# Altium schematic sheet PMODs_MIO.SchDoc
size A4; SheetNumber: 1; SheetTotal: 13
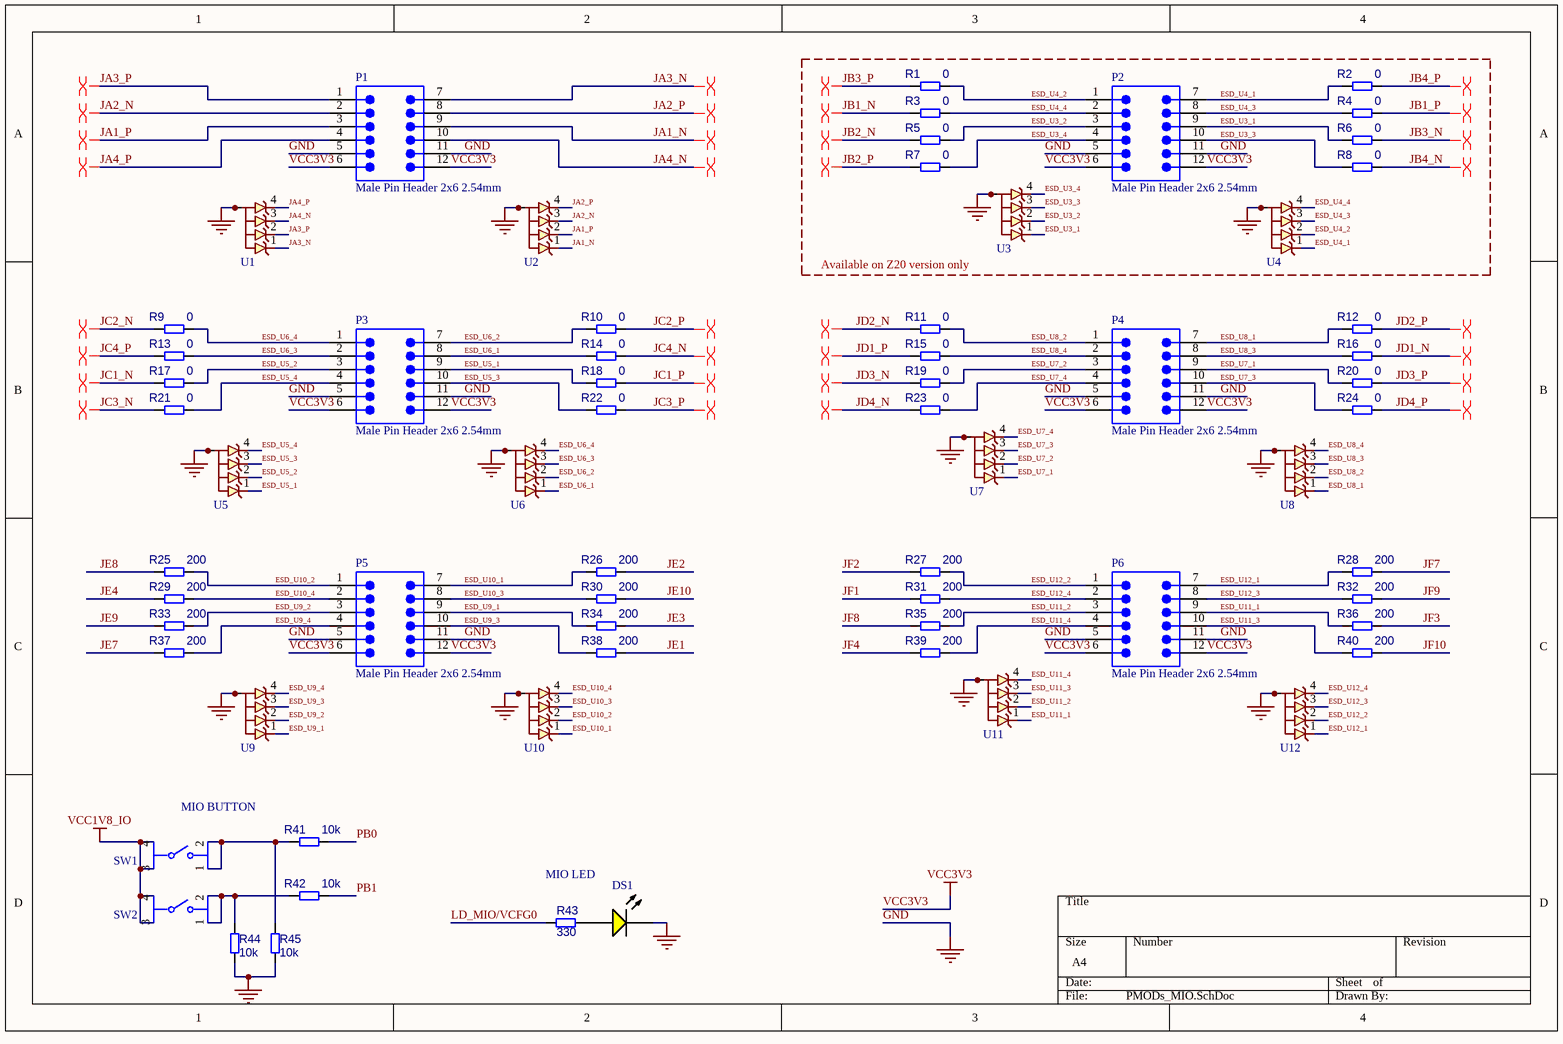
[diagram p0: PMODs_MIO.SchDoc]

## Parts
DS1  19-217/Y5C-AM1N1VY/3T  [EVRL-0603-2_V]  (value not drawn)
P1  Male Pin Header 2x6 2.54mm  [Copy of Copy of Copy of 3M-2340-6111TG_V]
P2  Male Pin Header 2x6 2.54mm  [Copy of Copy of Copy of 3M-2340-6111TG_V]
P3  Male Pin Header 2x6 2.54mm  [Copy of Copy of Copy of 3M-2340-6111TG_V]
P4  Male Pin Header 2x6 2.54mm  [Copy of Copy of Copy of 3M-2340-6111TG_V]
P5  Male Pin Header 2x6 2.54mm  [Copy of Copy of Copy of 3M-2340-6111TG_V]
P6  Male Pin Header 2x6 2.54mm  [Copy of Copy of Copy of 3M-2340-6111TG_V]
R1  0  [R_0402]
R2  0  [R_0402]
R3  0  [R_0402]
R4  0  [R_0402]
R5  0  [R_0402]
R6  0  [R_0402]
R7  0  [R_0402]
R8  0  [R_0402]
R9  0  [R_0402]
R10  0  [R_0402]
R11  0  [R_0402]
R12  0  [R_0402]
R13  0  [R_0402]
R14  0  [R_0402]
R15  0  [R_0402]
R16  0  [R_0402]
R17  0  [R_0402]
R18  0  [R_0402]
R19  0  [R_0402]
R20  0  [R_0402]
R21  0  [R_0402]
R22  0  [R_0402]
R23  0  [R_0402]
R24  0  [R_0402]
R25  200  [R_0402]
R26  200  [R_0402]
R27  200  [R_0402]
R28  200  [R_0402]
R29  200  [R_0402]
R30  200  [R_0402]
R31  200  [R_0402]
R32  200  [R_0402]
R33  200  [R_0402]
R34  200  [R_0402]
R35  200  [R_0402]
R36  200  [R_0402]
R37  200  [R_0402]
R38  200  [R_0402]
R39  200  [R_0402]
R40  200  [R_0402]
R41  10k  [R_0402]
R42  10k  [R_0402]
R43  330  [R_0402]
R44  10k  [R_0402]
R45  10k  [R_0402]
SW1  1301.9316.24  [FP-1301_9316_24-MFG]  (value not drawn)
SW2  1301.9316.24  [FP-1301_9316_24-MFG]  (value not drawn)
U1  TVS0701DRBR  [FP-DRB0008A-MFG]  (value not drawn)
U2  TVS0701DRBR  [FP-DRB0008A-MFG]  (value not drawn)
U3  TVS0701DRBR  [FP-DRB0008A-MFG]  (value not drawn)
U4  TVS0701DRBR  [FP-DRB0008A-MFG]  (value not drawn)
U5  TVS0701DRBR  [FP-DRB0008A-MFG]  (value not drawn)
U6  TVS0701DRBR  [FP-DRB0008A-MFG]  (value not drawn)
U7  TVS0701DRBR  [FP-DRB0008A-MFG]  (value not drawn)
U8  TVS0701DRBR  [FP-DRB0008A-MFG]  (value not drawn)
U9  TVS0701DRBR  [FP-DRB0008A-MFG]  (value not drawn)
U10  TVS0701DRBR  [FP-DRB0008A-MFG]  (value not drawn)
U11  TVS0701DRBR  [FP-DRB0008A-MFG]  (value not drawn)
U12  TVS0701DRBR  [FP-DRB0008A-MFG]  (value not drawn)

## Blocks framed on the sheet
Available on Z20 version only: P2 R1-R8 U3 U4

## Nets
GND: DS1.2(K) P1.5 P1.11 P2.5 P2.11 P3.5 P3.11 P4.5 P4.11 P5.5 P5.11 P6.5 P6.11 R44.1 R45.1 U1.5(GND) U1.6(GND) U1.7(GND) U1.8(GND) U1.9(Thermal_Pad) U2.5(GND) U2.6(GND) U2.7(GND) U2.8(GND) U2.9(Thermal_Pad) U3.5(GND) U3.6(GND) U3.7(GND) U3.8(GND) U3.9(Thermal_Pad) U4.5(GND) U4.6(GND) U4.7(GND) U4.8(GND) U4.9(Thermal_Pad) U5.5(GND) U5.6(GND) U5.7(GND) U5.8(GND) U5.9(Thermal_Pad) U6.5(GND) U6.6(GND) U6.7(GND) U6.8(GND) U6.9(Thermal_Pad) U7.5(GND) U7.6(GND) U7.7(GND) U7.8(GND) U7.9(Thermal_Pad) U8.5(GND) U8.6(GND) U8.7(GND) U8.8(GND) U8.9(Thermal_Pad) U9.5(GND) U9.6(GND) U9.7(GND) U9.8(GND) U9.9(Thermal_Pad) U10.5(GND) U10.6(GND) U10.7(GND) U10.8(GND) U10.9(Thermal_Pad) U11.5(GND) U11.6(GND) U11.7(GND) U11.8(GND) U11.9(Thermal_Pad) U12.5(GND) U12.6(GND) U12.7(GND) U12.8(GND) U12.9(Thermal_Pad)
VCC1V8_IO: SW1.3 SW1.4 SW2.3 SW2.4
VCC3V3: P1.6 P1.12 P2.6 P2.12 P3.6 P3.12 P4.6 P4.12 P5.6 P5.12 P6.6 P6.12
ESD_U3_1: P2.9 R6.1 U3.1(IN)
ESD_U3_2: P2.3 R5.2 U3.2(IN)
ESD_U3_3: P2.10 R8.1 U3.3(IN)
ESD_U3_4: P2.4 R7.2 U3.4(IN)
ESD_U4_1: P2.7 R2.1 U4.1(IN)
ESD_U4_2: P2.1 R1.2 U4.2(IN)
ESD_U4_3: P2.8 R4.1 U4.3(IN)
ESD_U4_4: P2.2 R3.2 U4.4(IN)
ESD_U5_1: P3.9 R18.1 U5.1(IN)
ESD_U5_2: P3.3 R17.2 U5.2(IN)
ESD_U5_3: P3.10 R22.1 U5.3(IN)
ESD_U5_4: P3.4 R21.2 U5.4(IN)
ESD_U6_1: P3.8 R14.1 U6.1(IN)
ESD_U6_2: P3.7 R10.1 U6.2(IN)
ESD_U6_3: P3.2 R13.2 U6.3(IN)
ESD_U6_4: P3.1 R9.2 U6.4(IN)
ESD_U7_1: P4.9 R20.1 U7.1(IN)
ESD_U7_2: P4.3 R19.2 U7.2(IN)
ESD_U7_3: P4.10 R24.1 U7.3(IN)
ESD_U7_4: P4.4 R23.2 U7.4(IN)
ESD_U8_1: P4.7 R12.1 U8.1(IN)
ESD_U8_2: P4.1 R11.2 U8.2(IN)
ESD_U8_3: P4.8 R16.1 U8.3(IN)
ESD_U8_4: P4.2 R15.2 U8.4(IN)
ESD_U9_1: P5.9 R34.1 U9.1(IN)
ESD_U9_2: P5.3 R33.2 U9.2(IN)
ESD_U9_3: P5.10 R38.1 U9.3(IN)
ESD_U9_4: P5.4 R37.2 U9.4(IN)
ESD_U10_1: P5.7 R26.1 U10.1(IN)
ESD_U10_2: P5.1 R25.2 U10.2(IN)
ESD_U10_3: P5.8 R30.1 U10.3(IN)
ESD_U10_4: P5.2 R29.2 U10.4(IN)
ESD_U11_1: P6.9 R36.1 U11.1(IN)
ESD_U11_2: P6.3 R35.2 U11.2(IN)
ESD_U11_3: P6.10 R40.1 U11.3(IN)
ESD_U11_4: P6.4 R39.2 U11.4(IN)
ESD_U12_1: P6.7 R28.1 U12.1(IN)
ESD_U12_2: P6.1 R27.2 U12.2(IN)
ESD_U12_3: P6.8 R32.1 U12.3(IN)
ESD_U12_4: P6.2 R31.2 U12.4(IN)
JA1_N: P1.9 U2.1(IN)
JA1_P: P1.3 U2.2(IN)
JA2_N: P1.2 U2.3(IN)
JA2_P: P1.8 U2.4(IN)
JA3_N: P1.7 U1.1(IN)
JA3_P: P1.1 U1.2(IN)
JA4_N: P1.10 U1.3(IN)
JA4_P: P1.4 U1.4(IN)
JB1_N: R3.1
JB1_P: R4.2
JB2_N: R5.1
JB2_P: R7.1
JB3_N: R6.2
JB3_P: R1.1
JB4_N: R8.2
JB4_P: R2.2
JC1_N: R17.1
JC1_P: R18.2
JC2_N: R9.1
JC2_P: R10.2
JC3_N: R21.1
JC3_P: R22.2
JC4_N: R14.2
JC4_P: R13.1
JD1_N: R16.2
JD1_P: R15.1
JD2_N: R11.1
JD2_P: R12.2
JD3_N: R19.1
JD3_P: R20.2
JD4_N: R23.1
JD4_P: R24.2
JE1: R38.2
JE2: R26.2
JE3: R34.2
JE4: R29.1
JE7: R37.1
JE8: R25.1
JE9: R33.1
JE10: R30.2
JF1: R31.1
JF2: R27.1
JF3: R36.2
JF4: R39.1
JF7: R28.2
JF8: R35.1
JF9: R32.2
JF10: R40.2
LD_MIO/VCFG0: R43.2
PB0: R41.2
PB1: R42.2
NetDS1_1: DS1.1(A) R43.1
NetR41_1: R41.1 R45.2 SW1.1 SW1.2
NetR42_1: R42.1 R44.2 SW2.1 SW2.2

## Layout directives
differential pair: JA1_N, JA1_P, JA2_N, JA2_P, JA3_N, JA3_P, JA4_N, JA4_P, JB1_N, JB1_P, JB2_N, JB2_P, JB3_N, JB3_P, JB4_N, JB4_P, JC1_N, JC1_P, JC2_N, JC2_P, JC3_N, JC3_P, JC4_N, JC4_P, JD1_N, JD1_P, JD2_N, JD2_P, JD3_N, JD3_P, JD4_N, JD4_P

## Notes on the sheet
- (near SW1) MIO BUTTON
- MIO LED

## Library data of the parts
DS1 = CMP-007-00005-2: Chip LED, Yellow, 5 V, 25mA, -40 to 85 degC, 2-Pin SMD (0603), RoHS, Tape and Reel; Manufacturer: Everlight Electronics; Datasheet Version: Rev. 1.0, 12/2005; Package Reference: 0603; Mounting Technology: SM; Package Description: 2-Pin Surface Mount Device, Body 1.6 x 0.8 mm; Case/Package: 0603; Datasheet URL: http://www.fairchip.com/pdf/Everlight/19-217-Y5C-AM1N1VY-3T.pdf; Manufacturer URL: http://www.everlight.com/; RoHS Compliant: False
P1-P6 = CMP-002-00077-1: Male Header, Pitch 2.54 mm, 2x6 Position, Height 8.636 mm, Tail Length 3.05 mm, -55 to 105 degC, RoHS, Bulk; Manufacturer: 3M; Current Rating: 3A; Rows: 1; Pins: 40; Case/Package: 2340-6111TG; Package Description: Male Header, Pitch 2.54 mm, 1 x 40 Position, Height 8.636 mm, Tail Length 3.05 mm; Mounting Technology: TH; Lead Pitch: 0.1inch; Contact Finish: Gold; Connector Type: Header; Manufacturer URL: http://www.3m.com/; Gender: Male; Min Operating Temperature: -55°C; Datasheet Version: Aug-08; Contact Plating: Gold; Packaging: Bulk; Package Reference: 2340-6111TG; Colour: Black; Max Current Rating: 3A; RoHS Compliant: True; Max Operating Temperature: 105°C; Package Quantity: 200; Datasheet URL: https://datasheet.ciiva.com/5161/ts0766-242217-5161112.pdf; Contact Material: Copper
R1-R45 = CMP-009-00178-3: Chip 0402 resistor
SW1 SW2 = CMP-00030-00001-1: Switch Tactile N.O. SPST Round Button Gull Wing 0.05A 12VDC >100000Cycles 1.6N SMD T/R; Max Operating Temperature: 70°C; Case/Package: SMD/SMT; Mounting Technology: Surface Mount; Min Operating Temperature: -20°C
U1-U12 = CMP-031-00006-4: 7-V bidirectional flat-clamp surge protection device 8-SON -40 to 125; Min Operating Temperature: -40°C; Pins: 8; Max Operating Temperature: 125°C